# Altium project lga1700.PrjPCB (part 4 of 11)

## Sheet CPU_PWR - +VCCCORE_2_3.schdoc
size 420 x 298 mm; Symbol: Sheet-Symbol_A3; Company: 嘉立创EDA; Version: V1.0; Page Size: A3; @Project Name: H610(2024/12/09); @Page Count: 36; @Update Date: 2025-10-09; @Create Date: 2025-10-09; @Schematic Name: SCHEMATIC1; @Page No: 28; @Page Name: CPU_PWR - +VCCCORE_2/3; Device: Sheet-Symbol_A3; @Board Name: SCHEMATIC1; @Create Time: 10:15:42; @Update Time: 10:18:20
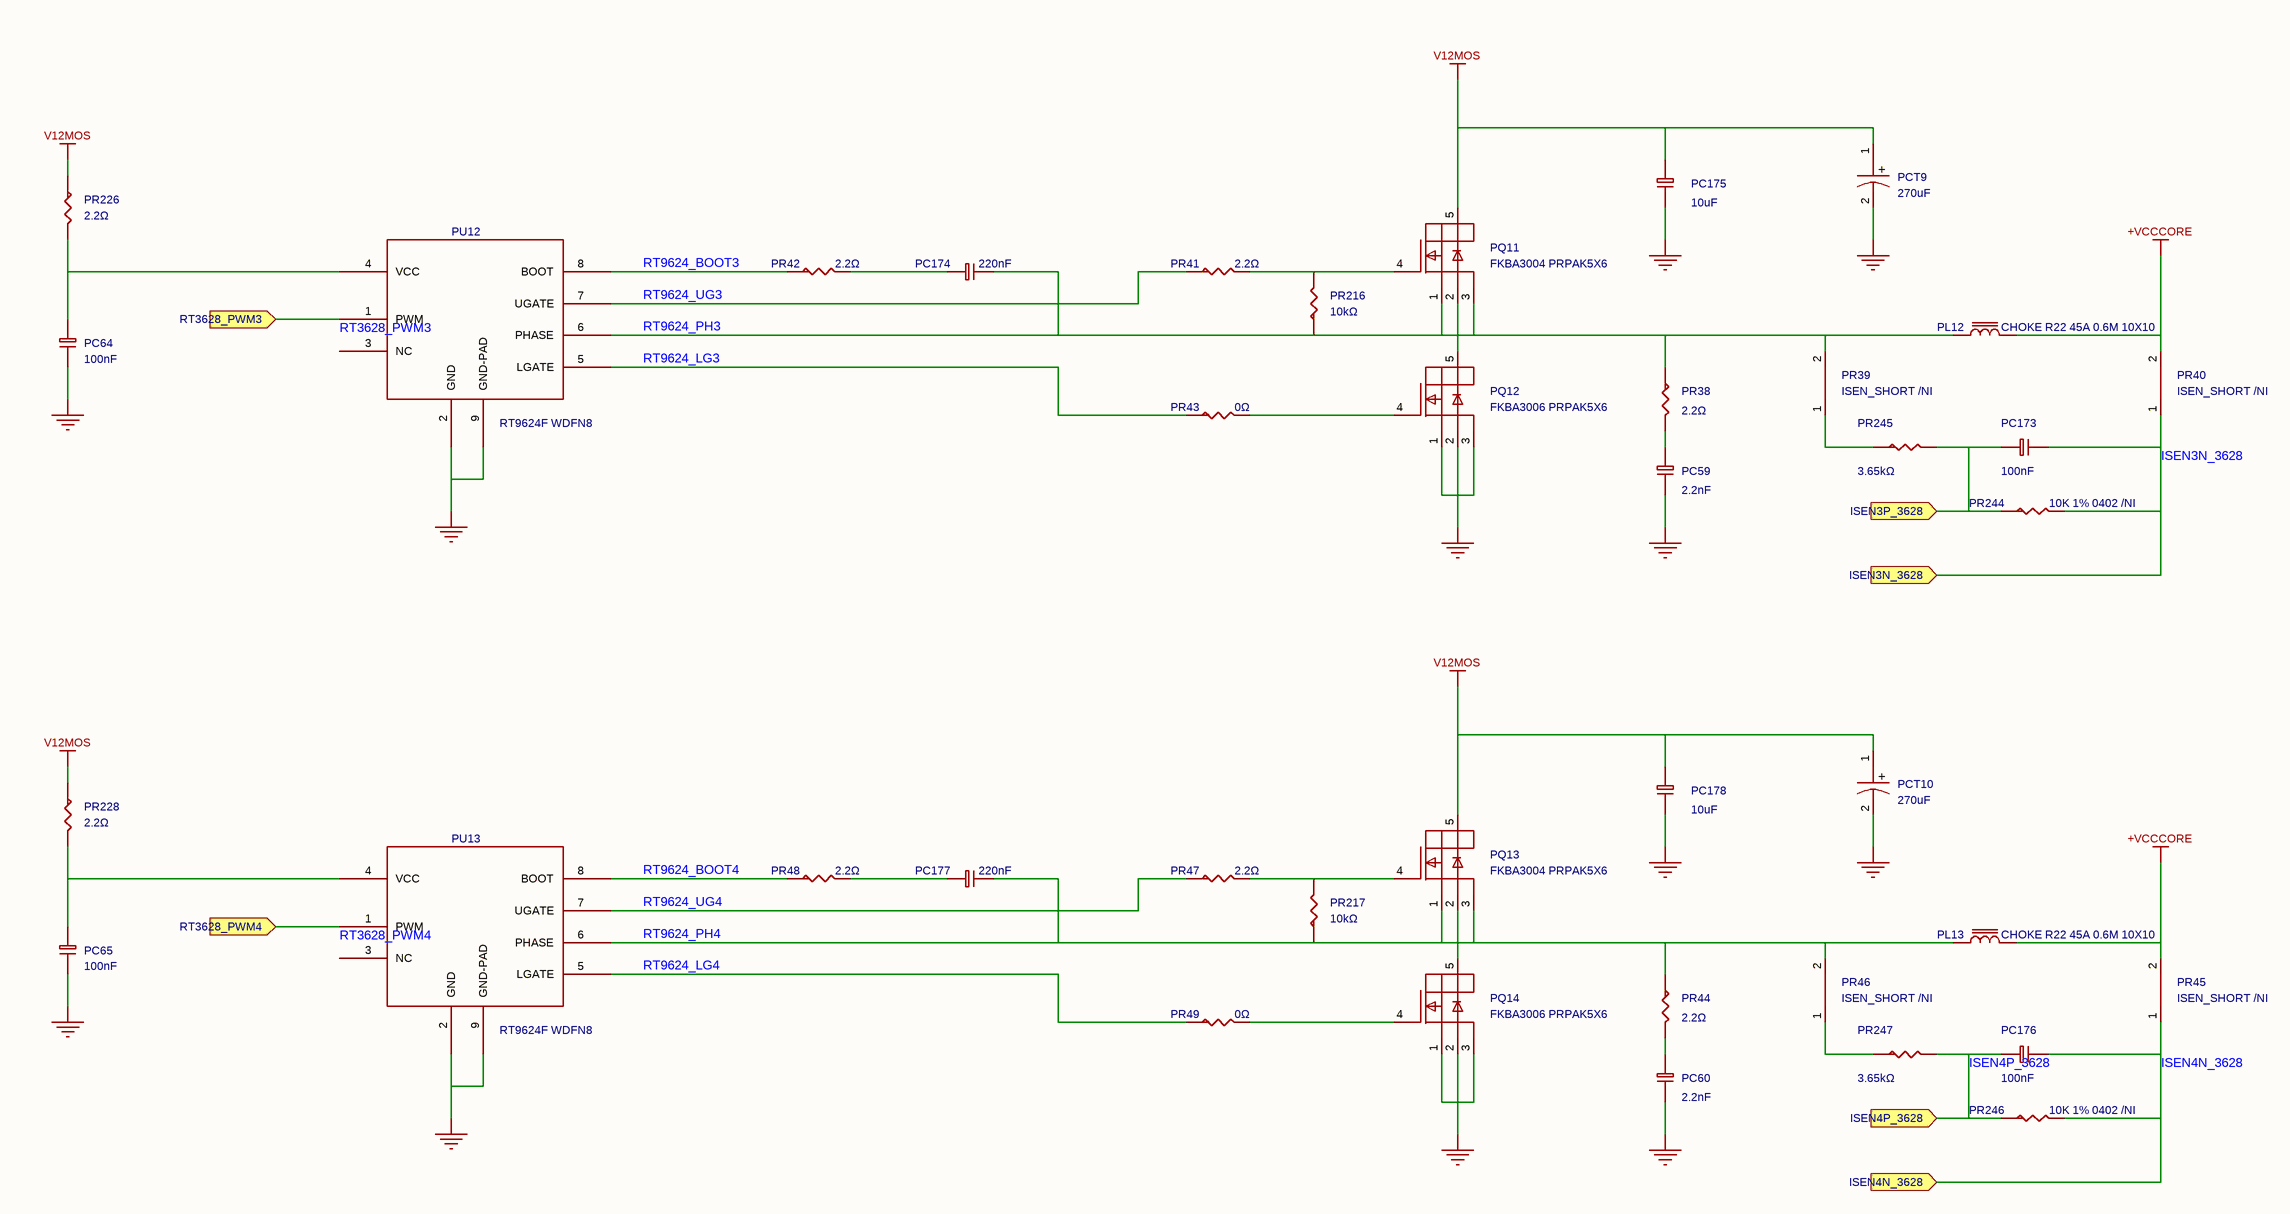
[diagram p13: CPU_PWR - +VCCCORE_2_3.schdoc]

### Parts
PC59  2.2nF  [C0402_2]
PC60  2.2nF  [C0402_3]
PC64  100nF  [C0402_1]
PC65  100nF  [C0402]
PC173  100nF  [C0402]
PC174  220nF  [C0402_1]
PC175  10uF  [C0805]
PC176  100nF  [C0402_1]
PC177  220nF  [C0402_2]
PC178  10uF  [C0805]
PCT9  270uF  [EC1P25C_1]
PCT10  270uF  [EC1P25C_2]
PL12  value CHOKE R22 45A 0.6M 10X10  [MAGIC R22]  (hidden comment: L_L70-P50-H70)
PL13  value CHOKE R22 45A 0.6M 10X10  [MAGIC R22]  (hidden comment: L_L70-P50-H70)
PQ11  value FKBA3004 PRPAK5X6  [PRPAK5X6_1]  (hidden comment: PK616BA)
PQ12  value FKBA3006 PRPAK5X6  [PRPAK5X6]  (hidden comment: PK616BA)
PQ13  value FKBA3004 PRPAK5X6  [PRPAK5X6_2]  (hidden comment: PK616BA)
PQ14  value FKBA3006 PRPAK5X6  [PRPAK5X6_3]  (hidden comment: PK616BA)
PR38  2.2Ω  [R0603_3]
PR39  value ISEN_SHORT /NI  [ISEN_SHORTNI]  (hidden comment: R_0)
PR40  value ISEN_SHORT /NI  [ISEN_SHORTNI]  (hidden comment: R_0)
PR41  2.2Ω  [R0603_1]
PR42  2.2Ω  [R0603_1]
PR43  0Ω  [R0603_3]
PR44  2.2Ω  [R0603_2]
PR45  value ISEN_SHORT /NI  [ISEN_SHORTNI_1]  (hidden comment: R_0)
PR46  value ISEN_SHORT /NI  [ISEN_SHORTNI_1]  (hidden comment: R_0)
PR47  2.2Ω  [R0603_1]
PR48  2.2Ω  [R0603_1]
PR49  0Ω  [R0603_2]
PR216  10kΩ  [R0402_1]
PR217  10kΩ  [R0402_2]
PR226  2.2Ω  [R0603]
PR228  2.2Ω  [R0603_2]
PR244  value 10K 1% 0402 /NI  [R0402_2]  (hidden comment: R-0603)
PR245  3.65kΩ  [R0402_2]
PR246  value 10K 1% 0402 /NI  [R0402_3]  (hidden comment: R-0603)
PR247  3.65kΩ  [R0402_3]
PU12  value RT9624F WDFN8  [DFN8_3X3MM-GND_1]  (hidden comment: RT9624FGQW)
PU13  value RT9624F WDFN8  [DFN8_3X3MM-GND_1]  (hidden comment: RT9624FGQW)

### Ports
ISEN3N_3628 (in), ISEN3P_3628 (in), ISEN4N_3628 (in), ISEN4P_3628 (in), RT3628_PWM3 (in), RT3628_PWM4 (in)

### Nets
+VCCCORE: PL12.2 PL13.2 PR40.2 PR45.2
GND: PC59.2 PC60.2 PC64.2 PC65.2 PC175.1 PC178.1 PCT9.2 PCT10.2 PQ12.1(SOURCE1) PQ12.2(SOURCE2) PQ12.3(SOURCE3) PQ14.1(SOURCE1) PQ14.2(SOURCE2) PQ14.3(SOURCE3) PU12.2(GND) PU12.9(GND-PAD) PU13.2(GND) PU13.9(GND-PAD)
V12MOS: PC175.2 PC178.2 PCT9.1 PCT10.1 PQ11.5(DRAIN1) PQ13.5(DRAIN1) PR226.1 PR228.1
ISEN3N_3628: PC173.2 PR40.1 PR244.2 ; port ISEN3N_3628
ISEN4N_3628: PC176.2 PR45.1 PR246.2 ; port ISEN4N_3628
ISEN4P_3628: PC176.1 PR246.1 PR247.2 ; port ISEN4P_3628
RT3628_PWM3: PU12.1(PWM) ; port RT3628_PWM3
RT3628_PWM4: PU13.1(PWM) ; port RT3628_PWM4
RT9624_BOOT3: PR42.1 PU12.8(BOOT)
RT9624_BOOT4: PR48.1 PU13.8(BOOT)
RT9624_LG3: PR43.1 PU12.5(LGATE)
RT9624_LG4: PR49.1 PU13.5(LGATE)
RT9624_PH3: PC174.2 PL12.1 PQ11.1(SOURCE1) PQ11.2(SOURCE2) PQ11.3(SOURCE3) PQ12.5(DRAIN1) PR38.1 PR39.2 PR216.1 PU12.6(PHASE)
RT9624_PH4: PC177.2 PL13.1 PQ13.1(SOURCE1) PQ13.2(SOURCE2) PQ13.3(SOURCE3) PQ14.5(DRAIN1) PR44.1 PR46.2 PR217.1 PU13.6(PHASE)
RT9624_UG3: PR41.1 PU12.7(UGATE)
RT9624_UG4: PR47.1 PU13.7(UGATE)
NetPC59_1: PC59.1 PR38.2
NetPC60_1: PC60.1 PR44.2
NetPC64_1: PC64.1 PR226.2 PU12.4(VCC)
NetPC65_1: PC65.1 PR228.2 PU13.4(VCC)
NetPC173_1: PC173.1 PR244.1 PR245.2 ; port ISEN3P_3628
NetPC174_1: PC174.1 PR42.2
NetPC177_1: PC177.1 PR48.2
NetPQ11_4: PQ11.4(GATE) PR41.2 PR216.2
NetPQ12_4: PQ12.4(GATE) PR43.2
NetPQ13_4: PQ13.4(GATE) PR47.2 PR217.2
NetPQ14_4: PQ14.4(GATE) PR49.2
NetPR39_1: PR39.1 PR245.1
NetPR46_1: PR46.1 PR247.1

Not connected (* = marked no-connect by the designer): PU12 3(NC); PU13 3(NC)

### Notes on the sheet
- 更新日期
- 2025-10-09
- 原理图
- 图页
- SCHEMATIC1
- CPU_PWR - +VCCCORE_2/3
- 创建日期
- 物料编码
- 审阅
- 绘制
- H610(2024/12/09)
- 版本
- V1.0
- 尺寸
- A3
- 页
- 28
- 嘉立创EDA
- 共
- 36
- (in symbol 160AREC271M0609) +

### Library data of the parts
PC59 PC60 = CC0402KRX7R9BB222: as PC57 on sheet CPU_PWR - +VCCCORE_1_3; Device: CC0402KRX7R9BB222; Value: 2.2nF; Supplier: LCSC; Datasheet: https://atta.szlcsc.com/upload/public/pdf/source/20170505/1493957848374.pdf; SupplierPart: C106861; ConvertToPcb: yes; LCSC Part Name: 2.2nF ±10% 50V; JLCPCB Part Class: Extended Part; ManufacturerPart: CC0402KRX7R9BB222; Supplier Footprint: 0402
  PC59: FootprintName: C0402_2
  PC60: FootprintName: C0402_3
PC64 PC176 = CL05B104KO5NNNC: as PC167 on sheet CPU_PWR - +VCCCORE_1_3; Device: CL05B104KO5NNNC; Value: 100nF; Supplier: LCSC; Datasheet: https://atta.szlcsc.com/upload/public/pdf/source/20160103/1457707674891.pdf; FootprintName: C0402_1; SupplierPart: C1525; ConvertToPcb: yes; LCSC Part Name: 100nF ±10% 16V; JLCPCB Part Class: Basic Part; ManufacturerPart: CL05B104KO5NNNC; Supplier Footprint: 0402
PC65 PC173 = CL05B104KO5NNNC: as PC62 on sheet CPU_PWR - +VCCCORE_1_3; Device: CL05B104KO5NNNC; PCB Footprint: C0402; Value: 100nF; Supplier: LCSC; Datasheet: https://atta.szlcsc.com/upload/public/pdf/source/20160103/1457707674891.pdf; FootprintName: C0402; SupplierPart: C1525; ConvertToPcb: yes; LCSC Part Name: 100nF ±10% 16V; JLCPCB Part Class: Basic Part; ManufacturerPart: CL05B104KO5NNNC; Supplier Footprint: 0402
PC174 PC177 = CC0402KRX5R7BB224: 容值:220nF;精度:±10%;额定电压:16V;材质(温度系数):X5R;; Manufacturer: YAGEO(国巨); Symbol: CAP; PCB Footprint: C0402; Tolerance: ±10%; ModelId: 36a51122f27c49738f86b3bfa98863e0; AddInBom: yes; Voltage Rated: 16V; ModelName: C0402_L1.0-W0.5-H0.5; ModelTransform: 39.37,19.685,0,0,0,0,0,0,0; Temperature Coefficient: X5R; Device: CC0402KRX5R7BB224; Value: 220nF; Supplier: LCSC; Datasheet: https://atta.szlcsc.com/upload/public/pdf/source/20170728/C106258_1501225689337848724.pdf; SupplierPart: C106258; ConvertToPcb: yes; LCSC Part Name: 220nF ±10% 16V; JLCPCB Part Class: Extended Part; ManufacturerPart: CC0402KRX5R7BB224; Supplier Footprint: 0402
  PC174: FootprintName: C0402_1
  PC177: FootprintName: C0402_2
PC175 PC178 = CL21A106KOQNNNE: as C635 on sheet COM; Device: CL21A106KOQNNNE; Value: 10uF; Supplier: LCSC; Datasheet: https://atta.szlcsc.com/upload/public/pdf/source/20160103/1457707694240.pdf; FootprintName: C0805; SupplierPart: C1713; ConvertToPcb: yes; LCSC Part Name: 10uF ±10% 16V; JLCPCB Part Class: Extended Part; ManufacturerPart: CL21A106KOQNNNE; Supplier Footprint: 0805
PCT9 PCT10 = 160AREC271M0609: as PCT7 on sheet CPU_PWR - +VCCCORE_1_3; Device: 160AREC271M0609; Value: 270uF; LCSC Part Name: 270uF ±20% 16V; SupplierPart: C176312; ManufacturerPart: 160AREC271M0609; Supplier Footprint: 插件,D6.3xL9mm; JLCPCB Part Class: Extended Part; Datasheet: https://atta.szlcsc.com/upload/public/pdf/source/20180420/C176312_A6CC051F3F5535015096354530D22B11.pdf; Supplier: LCSC; ConvertToPcb: yes; Ripple Current: 3.8A@100kHz; Equivalent Series Resistance(ESR): 15mΩ@100kHz~300kHz; Type: -; Lead Spacing: 2.5mm; Operating Temperature: -55℃~+105℃
  PCT9: FootprintName: EC1P25C_1
  PCT10: FootprintName: EC1P25C_2
PL12 = L_L70-P50-H70_1: Check: false; AddInBom: yes; Device: L_L70-P50-H70_1; Symbol: L_L70-P50-H70; FootprintName: MAGIC R22; ConvertToPcb: yes
PL13 = L_L70-P50-H70_2: Check: false; AddInBom: yes; Device: L_L70-P50-H70_2; Symbol: L_L70-P50-H70; FootprintName: MAGIC R22; ConvertToPcb: yes
PQ11-PQ14 = PK616BA: as PQ7-PQ10 on sheet CPU_PWR - +VCCCORE_1_3; Device: PK616BA; LCSC Part Name: 1个N沟道 耐压:30V 电流:50A; SupplierPart: C133608; ManufacturerPart: PK616BA; Supplier Footprint: PDFN-8(5.8x4.9); JLCPCB Part Class: Extended Part; Datasheet: https://atta.szlcsc.com/upload/public/pdf/source/20170930/C133608_1506736454344997453.pdf; Supplier: LCSC; ConvertToPcb: yes; Type: 1个N沟道; Drain Source On Resistance (RDS(on)@Vgs,Id): 9.5mΩ@4.5V,13A; Gate Threshold Voltage (Vgs(th)@Id): 3V@250uA
  PQ11: FootprintName: PRPAK5X6_1
  PQ12: FootprintName: PRPAK5X6
  PQ13: FootprintName: PRPAK5X6_2
  PQ14: FootprintName: PRPAK5X6_3
PR38 PR41 PR42 PR44 PR47 PR48 PR228 = 0603WAF220KT5E: as PR28 on sheet CPU_PWR - +VCCCORE_1_3; Device: 0603WAF220KT5E; Value: 2.2Ω; Type: 厚膜电阻; Supplier: LCSC; Datasheet: https://atta.szlcsc.com/upload/public/pdf/source/20200306/C422600_1E6D84923E4A46A82E41ADD87F860B5C.pdf; SupplierPart: C22939; ConvertToPcb: yes; LCSC Part Name: 2.2Ω ±1% 100mW; JLCPCB Part Class: Basic Part; ManufacturerPart: 0603WAF220KT5E; Supplier Footprint: 0603; Operating Temperature Range: -55℃~+155℃
  PR38: FootprintName: R0603_3
  PR41 PR42 PR47 PR48: FootprintName: R0603_1
  PR44 PR228: FootprintName: R0603_2
PR39 = R_0: Check: false; AddInBom: yes; Device: R_0; Symbol: R_0; FootprintName: ISEN_SHORTNI; ConvertToPcb: yes
PR40 = R_0: 跳线; Check: false; AddInBom: yes; Device: R_0; Symbol: R_0; FootprintName: ISEN_SHORTNI; ConvertToPcb: yes
PR43 PR49 = 0603WAF0000T5E: as PR34 on sheet CPU_PWR - +VCCCORE_1_3; Device: 0603WAF0000T5E; Value: 0Ω; Type: 厚膜电阻; Supplier: LCSC; Datasheet: https://atta.szlcsc.com/upload/public/pdf/source/20200306/C422600_1E6D84923E4A46A82E41ADD87F860B5C.pdf; SupplierPart: C21189; ConvertToPcb: yes; LCSC Part Name: 0Ω ±1% 100mW; JLCPCB Part Class: Basic Part; ManufacturerPart: 0603WAF0000T5E; Supplier Footprint: 0603; Operating Temperature Range: -55℃~+155℃
  PR43: FootprintName: R0603_3
  PR49: FootprintName: R0603_2
PR45 PR46 = R_1: Check: false; AddInBom: yes; Device: R_1; Symbol: R_0; FootprintName: ISEN_SHORTNI_1; ConvertToPcb: yes
PR216 PR217 = 0402WGF1002TCE: as PR214 on sheet CPU_PWR - +VCCCORE_1_3; Device: 0402WGF1002TCE; Value: 10kΩ; Type: 厚膜电阻; Supplier: LCSC; Datasheet: https://atta.szlcsc.com/upload/public/pdf/source/20200306/C422600_1E6D84923E4A46A82E41ADD87F860B5C.pdf; SupplierPart: C25744; ConvertToPcb: yes; LCSC Part Name: 10kΩ ±1% 62.5mW; JLCPCB Part Class: Basic Part; ManufacturerPart: 0402WGF1002TCE; Supplier Footprint: 0402; Operating Temperature Range: -55℃~+155℃
  PR216: FootprintName: R0402_1
  PR217: FootprintName: R0402_2
PR226 = 0603WAF220KT5E: as PR224 on sheet CPU_PWR - +VCCCORE_1_3; Device: 0603WAF220KT5E; Value: 2.2Ω; Type: 厚膜电阻; Supplier: LCSC; Datasheet: https://atta.szlcsc.com/upload/public/pdf/source/20200306/C422600_1E6D84923E4A46A82E41ADD87F860B5C.pdf; FootprintName: R0603; SupplierPart: C22939; ModelName: R0603; ConvertToPcb: yes; LCSC Part Name: 2.2Ω ±1% 100mW; JLCPCB Part Class: Basic Part; ManufacturerPart: 0603WAF220KT5E; Supplier Footprint: 0603; Operating Temperature Range: -55℃~+155℃
PR244 = R-0603_2: as PR240 on sheet CPU_PWR - +VCCCORE_1_3; Device: R-0603_2; Symbol: R-0603; LCSC Part Name: 厚膜电阻 10kΩ ±1% 62.5mW; Supplier Part: C60490; Supplier Footprint: 0402; JLCPCB Part Class: Extended Part; Datasheet: https://atta.szlcsc.com/upload/public/pdf/source/20170925/C131467_1506321478108990263.pdf; Supplier: LCSC; Type: 厚膜电阻; Operating Temperature Range: -55℃~+155℃; FootprintName: R0402_2; ConvertToPcb: yes
PR245 PR247 = ERJ2RKF3651X: as PR241 on sheet CPU_PWR - +VCCCORE_1_3; Device: ERJ2RKF3651X; Value: 3.65kΩ; LCSC Part Name: 3.65kΩ ±1% 100mW 厚膜电阻; SupplierPart: C416527; ManufacturerPart: ERJ2RKF3651X; Supplier Footprint: 0402; JLCPCB Part Class: Extended Part; Datasheet: https://atta.szlcsc.com/upload/public/pdf/source/20190902/C416527_C4564A8D72F3E2A9CDC3D7769B95121D.pdf; Supplier: LCSC; ConvertToPcb: yes; Type: 厚膜电阻; Temperature Coefficient: ±100ppm/℃; Operating Temperature Range: -55℃~+155℃
  PR245: FootprintName: R0402_2
  PR247: FootprintName: R0402_3
PR246 = R-0603: Manufacturer: YAGEO(国巨); Manufacturer Part: RC0402FR-0710KL; 3D Model: 671aefced39d4c318694bba8bd8efd39; 3D Model Transform: 39.37,19.685,0,0,0,0,0,0.0005,0; Tolerance: ±1%; Power(Watts): 62.5mW; Overload Voltage (Max): 50V; Temperature Coefficient: ±100ppm/℃; AddInBom: yes; Device: R-0603; Symbol: R-0603; LCSC Part Name: 厚膜电阻 10kΩ ±1% 62.5mW; Supplier Part: C60490; Supplier Footprint: 0402; JLCPCB Part Class: Extended Part; Datasheet: https://atta.szlcsc.com/upload/public/pdf/source/20170925/C131467_1506321478108990263.pdf; Supplier: LCSC; Type: 厚膜电阻; Operating Temperature Range: -55℃~+155℃; FootprintName: R0402_3; ConvertToPcb: yes
PU12 PU13 = RT9624FGQW: as PU10 on sheet CPU_PWR - +VCCCORE_1_3; Device: RT9624FGQW; LCSC Part Name: Single Phase Synchronous Rectified Buck MOSFET Driver; SupplierPart: C3020454; ManufacturerPart: RT9624FGQW; Supplier Footprint: TDFN-8-EP(3x3); JLCPCB Part Class: Extended Part; Datasheet: https://atta.szlcsc.com/upload/public/pdf/source/20220608/64F557171D909C63F38446B0F2BC2FB2.pdf; Supplier: LCSC; ConvertToPcb: yes; FootprintName: DFN8_3X3MM-GND_1

## Sheet CPU_PWR - +VCCCORE_3_3.schdoc
size 420 x 297 mm; Symbol: Sheet-Symbol_A4; Company: 嘉立创EDA; Version: V1.0; Page Size: A4; @Project Name: 【全网首发】X86电脑主板_copy; @Page Count: 24; @Update Date: 2025-10-09; @Create Date: 2025-10-09; @Schematic Name: SCHEMATIC1_1; @Page No: 0; @Page Name: CPU_PWR - +VCCCORE_3/3; Device: Sheet-Symbol_A4_1; Border: 1; Width: 1655; Height: 1170; Region Start: 1; X Region Count: 6; Y Region Count: 4; Blade Width: 10; Title Block Position: 3
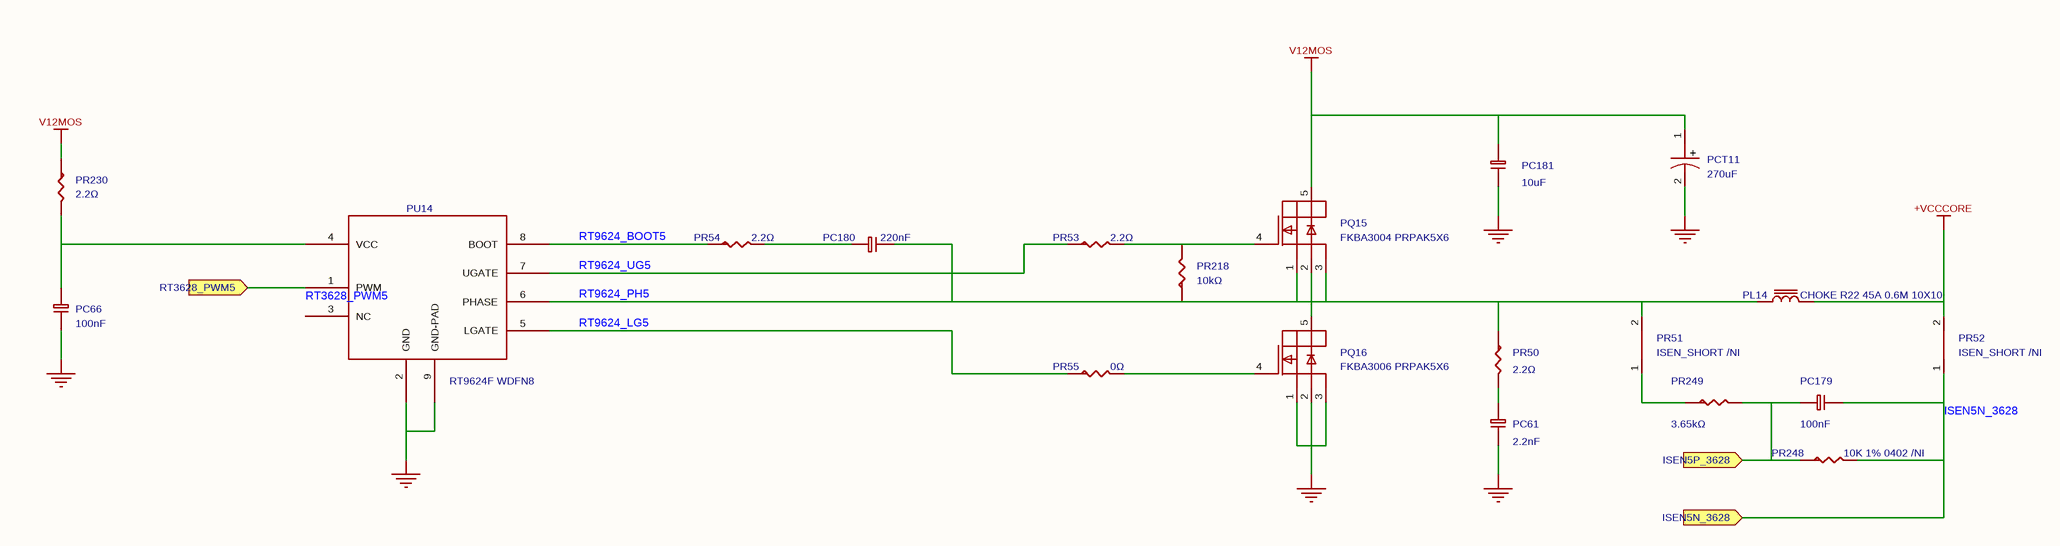
[diagram p14: CPU_PWR - +VCCCORE_3_3.schdoc]

### Parts
PC61  2.2nF  [C0402_3]
PC66  100nF  [C0402_3]
PC179  100nF  [C0402_2]
PC180  220nF  [C0402]
PC181  10uF  [C0805]
PCT11  270uF  [EC1P25C_2]
PL14  value CHOKE R22 45A 0.6M 10X10  [MAGIC R22]  (hidden comment: L_L70-P50-H70)
PQ15  value FKBA3004 PRPAK5X6  [PRPAK5X6_4]  (hidden comment: PK616BA)
PQ16  value FKBA3006 PRPAK5X6  [PRPAK5X6_5]  (hidden comment: PK616BA)
PR50  2.2Ω  [R0603_2]
PR51  value ISEN_SHORT /NI  [ISEN_SHORTNI_1]  (hidden comment: R_0)
PR52  value ISEN_SHORT /NI  [ISEN_SHORTNI_1]  (hidden comment: R_0)
PR53  2.2Ω  [R0603_1]
PR54  2.2Ω  [R0603]
PR55  0Ω  [R0603_2]
PR218  10kΩ  [R0402_2]
PR230  2.2Ω  [R0603]
PR248  value 10K 1% 0402 /NI  [R0402_1]  (hidden comment: R-0603)
PR249  3.65kΩ  [R0402_1]
PU14  value RT9624F WDFN8  [DFN8_3X3MM-GND_2]  (hidden comment: RT9624FGQW)

### Ports
ISEN5N_3628 (in), ISEN5P_3628 (in), RT3628_PWM5 (in)

### Nets
+VCCCORE: PL14.2 PR52.2
GND: PC61.2 PC66.2 PC181.1 PCT11.2 PQ16.1(SOURCE1) PQ16.2(SOURCE2) PQ16.3(SOURCE3) PU14.2(GND) PU14.9(GND-PAD)
V12MOS: PC181.2 PCT11.1 PQ15.5(DRAIN1) PR230.1
ISEN5N_3628: PC179.2 PR52.1 PR248.2 ; port ISEN5N_3628
RT3628_PWM5: PU14.1(PWM) ; port RT3628_PWM5
RT9624_BOOT5: PR54.1 PU14.8(BOOT)
RT9624_LG5: PR55.1 PU14.5(LGATE)
RT9624_PH5: PC180.2 PL14.1 PQ15.1(SOURCE1) PQ15.2(SOURCE2) PQ15.3(SOURCE3) PQ16.5(DRAIN1) PR50.1 PR51.2 PR218.1 PU14.6(PHASE)
RT9624_UG5: PR53.1 PU14.7(UGATE)
NetPC61_1: PC61.1 PR50.2
NetPC66_1: PC66.1 PR230.2 PU14.4(VCC)
NetPC179_1: PC179.1 PR248.1 PR249.2 ; port ISEN5P_3628
NetPC180_1: PC180.1 PR54.2
NetPQ15_4: PQ15.4(GATE) PR53.2 PR218.2
NetPQ16_4: PQ16.4(GATE) PR55.2
NetPR51_1: PR51.1 PR249.1

Not connected (* = marked no-connect by the designer): PU14 3(NC)

### Notes on the sheet
- 2025-10-09
- 更新日期
- SCHEMATIC1_1
- CPU_PWR - +VCCCORE_3/3
- 原理图
- 图页
- 创建日期
- 物料编码
- 【全网首发】X86电脑主板_copy
- 审阅
- 绘制
- V1.0
- A4
- 0
- 嘉立创EDA
- 24
- 版本
- 尺寸
- 页
- 共
- 1
- (in symbol 160AREC271M0609) +

### Library data of the parts
PC61 = CC0402KRX7R9BB222: as PC57 on sheet CPU_PWR - +VCCCORE_1_3; Device: CC0402KRX7R9BB222; Value: 2.2nF; Supplier: LCSC; Datasheet: https://atta.szlcsc.com/upload/public/pdf/source/20170505/1493957848374.pdf; FootprintName: C0402_3; SupplierPart: C106861; ConvertToPcb: yes; LCSC Part Name: 2.2nF ±10% 50V; JLCPCB Part Class: Extended Part; ManufacturerPart: CC0402KRX7R9BB222; Supplier Footprint: 0402
PC66 PC179 = CL05B104KO5NNNC: as PC167 on sheet CPU_PWR - +VCCCORE_1_3; Device: CL05B104KO5NNNC; Value: 100nF; Supplier: LCSC; Datasheet: https://atta.szlcsc.com/upload/public/pdf/source/20160103/1457707674891.pdf; SupplierPart: C1525; ConvertToPcb: yes; LCSC Part Name: 100nF ±10% 16V; JLCPCB Part Class: Basic Part; ManufacturerPart: CL05B104KO5NNNC; Supplier Footprint: 0402
  PC66: FootprintName: C0402_3
  PC179: FootprintName: C0402_2
PC180 = CC0402KRX5R7BB224: 容值:220nF;精度:±10%;额定电压:16V;材质(温度系数):X5R;; Manufacturer: YAGEO(国巨); Symbol: CAP; Tolerance: ±10%; ModelId: 36a51122f27c49738f86b3bfa98863e0; AddInBom: yes; Voltage Rated: 16V; ModelName: C0402_L1.0-W0.5-H0.5; ModelTransform: 39.37,19.685,0,0,0,0,0,0,0; Temperature Coefficient: X5R; Device: CC0402KRX5R7BB224; PCB Footprint: C0402; Value: 220nF; Supplier: LCSC; Datasheet: https://atta.szlcsc.com/upload/public/pdf/source/20170728/C106258_1501225689337848724.pdf; FootprintName: C0402; SupplierPart: C106258; ConvertToPcb: yes; LCSC Part Name: 220nF ±10% 16V; JLCPCB Part Class: Extended Part; ManufacturerPart: CC0402KRX5R7BB224; Supplier Footprint: 0402
PC181 = CL21A106KOQNNNE: as C635 on sheet COM; Device: CL21A106KOQNNNE; Value: 10uF; Supplier: LCSC; Datasheet: https://atta.szlcsc.com/upload/public/pdf/source/20160103/1457707694240.pdf; FootprintName: C0805; SupplierPart: C1713; ConvertToPcb: yes; LCSC Part Name: 10uF ±10% 16V; JLCPCB Part Class: Extended Part; ManufacturerPart: CL21A106KOQNNNE; Supplier Footprint: 0805
PCT11 = 160AREC271M0609: as PCT7 on sheet CPU_PWR - +VCCCORE_1_3; Device: 160AREC271M0609; Value: 270uF; LCSC Part Name: 270uF ±20% 16V; SupplierPart: C176312; ManufacturerPart: 160AREC271M0609; Supplier Footprint: 插件,D6.3xL9mm; JLCPCB Part Class: Extended Part; Datasheet: https://atta.szlcsc.com/upload/public/pdf/source/20180420/C176312_A6CC051F3F5535015096354530D22B11.pdf; Supplier: LCSC; ConvertToPcb: yes; FootprintName: EC1P25C_2; Ripple Current: 3.8A@100kHz; Equivalent Series Resistance(ESR): 15mΩ@100kHz~300kHz; Type: -; Lead Spacing: 2.5mm; Operating Temperature: -55℃~+105℃
PL14 = L_L70-P50-H70_2: Check: false; AddInBom: yes; Device: L_L70-P50-H70_2; Symbol: L_L70-P50-H70; FootprintName: MAGIC R22; ConvertToPcb: yes
PQ15 PQ16 = PK616BA: as PQ7-PQ10 on sheet CPU_PWR - +VCCCORE_1_3; Device: PK616BA; LCSC Part Name: 1个N沟道 耐压:30V 电流:50A; SupplierPart: C133608; ManufacturerPart: PK616BA; Supplier Footprint: PDFN-8(5.8x4.9); JLCPCB Part Class: Extended Part; Datasheet: https://atta.szlcsc.com/upload/public/pdf/source/20170930/C133608_1506736454344997453.pdf; Supplier: LCSC; ConvertToPcb: yes; Type: 1个N沟道; Drain Source On Resistance (RDS(on)@Vgs,Id): 9.5mΩ@4.5V,13A; Gate Threshold Voltage (Vgs(th)@Id): 3V@250uA
  PQ15: FootprintName: PRPAK5X6_4
  PQ16: FootprintName: PRPAK5X6_5
PR50 PR53 = 0603WAF220KT5E: as PR28 on sheet CPU_PWR - +VCCCORE_1_3; Device: 0603WAF220KT5E; Value: 2.2Ω; Type: 厚膜电阻; Supplier: LCSC; Datasheet: https://atta.szlcsc.com/upload/public/pdf/source/20200306/C422600_1E6D84923E4A46A82E41ADD87F860B5C.pdf; SupplierPart: C22939; ConvertToPcb: yes; LCSC Part Name: 2.2Ω ±1% 100mW; JLCPCB Part Class: Basic Part; ManufacturerPart: 0603WAF220KT5E; Supplier Footprint: 0603; Operating Temperature Range: -55℃~+155℃
  PR50: FootprintName: R0603_2
  PR53: FootprintName: R0603_1
PR51 PR52 = R_1: Check: false; AddInBom: yes; Device: R_1; Symbol: R_0; FootprintName: ISEN_SHORTNI_1; ConvertToPcb: yes
PR54 PR230 = 0603WAF220KT5E: as PR224 on sheet CPU_PWR - +VCCCORE_1_3; Device: 0603WAF220KT5E; Value: 2.2Ω; Type: 厚膜电阻; Supplier: LCSC; Datasheet: https://atta.szlcsc.com/upload/public/pdf/source/20200306/C422600_1E6D84923E4A46A82E41ADD87F860B5C.pdf; FootprintName: R0603; SupplierPart: C22939; ModelName: R0603; ConvertToPcb: yes; LCSC Part Name: 2.2Ω ±1% 100mW; JLCPCB Part Class: Basic Part; ManufacturerPart: 0603WAF220KT5E; Supplier Footprint: 0603; Operating Temperature Range: -55℃~+155℃
PR55 = 0603WAF0000T5E: as PR34 on sheet CPU_PWR - +VCCCORE_1_3; Device: 0603WAF0000T5E; Value: 0Ω; Type: 厚膜电阻; Supplier: LCSC; Datasheet: https://atta.szlcsc.com/upload/public/pdf/source/20200306/C422600_1E6D84923E4A46A82E41ADD87F860B5C.pdf; FootprintName: R0603_2; SupplierPart: C21189; ConvertToPcb: yes; LCSC Part Name: 0Ω ±1% 100mW; JLCPCB Part Class: Basic Part; ManufacturerPart: 0603WAF0000T5E; Supplier Footprint: 0603; Operating Temperature Range: -55℃~+155℃
PR218 = 0402WGF1002TCE: as PR214 on sheet CPU_PWR - +VCCCORE_1_3; Device: 0402WGF1002TCE; Value: 10kΩ; Type: 厚膜电阻; Supplier: LCSC; Datasheet: https://atta.szlcsc.com/upload/public/pdf/source/20200306/C422600_1E6D84923E4A46A82E41ADD87F860B5C.pdf; FootprintName: R0402_2; SupplierPart: C25744; ConvertToPcb: yes; LCSC Part Name: 10kΩ ±1% 62.5mW; JLCPCB Part Class: Basic Part; ManufacturerPart: 0402WGF1002TCE; Supplier Footprint: 0402; Operating Temperature Range: -55℃~+155℃
PR248 = R-0603_3: as PR242 on sheet CPU_PWR - +VCCCORE_1_3; Device: R-0603_3; Symbol: R-0603; LCSC Part Name: 厚膜电阻 10kΩ ±1% 62.5mW; Supplier Part: C60490; Supplier Footprint: 0402; JLCPCB Part Class: Extended Part; Datasheet: https://atta.szlcsc.com/upload/public/pdf/source/20170925/C131467_1506321478108990263.pdf; Supplier: LCSC; Type: 厚膜电阻; Operating Temperature Range: -55℃~+155℃; FootprintName: R0402_1; ConvertToPcb: yes
PR249 = ERJ2RKF3651X: as PR241 on sheet CPU_PWR - +VCCCORE_1_3; Device: ERJ2RKF3651X; Value: 3.65kΩ; LCSC Part Name: 3.65kΩ ±1% 100mW 厚膜电阻; SupplierPart: C416527; ManufacturerPart: ERJ2RKF3651X; Supplier Footprint: 0402; JLCPCB Part Class: Extended Part; Datasheet: https://atta.szlcsc.com/upload/public/pdf/source/20190902/C416527_C4564A8D72F3E2A9CDC3D7769B95121D.pdf; Supplier: LCSC; ConvertToPcb: yes; FootprintName: R0402_1; Type: 厚膜电阻; Temperature Coefficient: ±100ppm/℃; Operating Temperature Range: -55℃~+155℃
PU14 = RT9624FGQW: as PU10 on sheet CPU_PWR - +VCCCORE_1_3; Device: RT9624FGQW; LCSC Part Name: Single Phase Synchronous Rectified Buck MOSFET Driver; SupplierPart: C3020454; ManufacturerPart: RT9624FGQW; Supplier Footprint: TDFN-8-EP(3x3); JLCPCB Part Class: Extended Part; Datasheet: https://atta.szlcsc.com/upload/public/pdf/source/20220608/64F557171D909C63F38446B0F2BC2FB2.pdf; Supplier: LCSC; ConvertToPcb: yes; FootprintName: DFN8_3X3MM-GND_2

## Sheet CPU_PWR - +VCCGT.schdoc
size 420 x 298 mm; Symbol: Sheet-Symbol_A3; Company: 嘉立创EDA; Version: V1.0; Page Size: A3; @Project Name: 【全网首发】X86电脑主板_copy; @Page Count: 35; @Update Date: 2025-10-09; @Create Date: 2025-10-09; @Schematic Name: SCHEMATIC1_1; @Page No: 0; @Page Name: CPU_PWR - +VCCGT; Device: Sheet-Symbol_A3
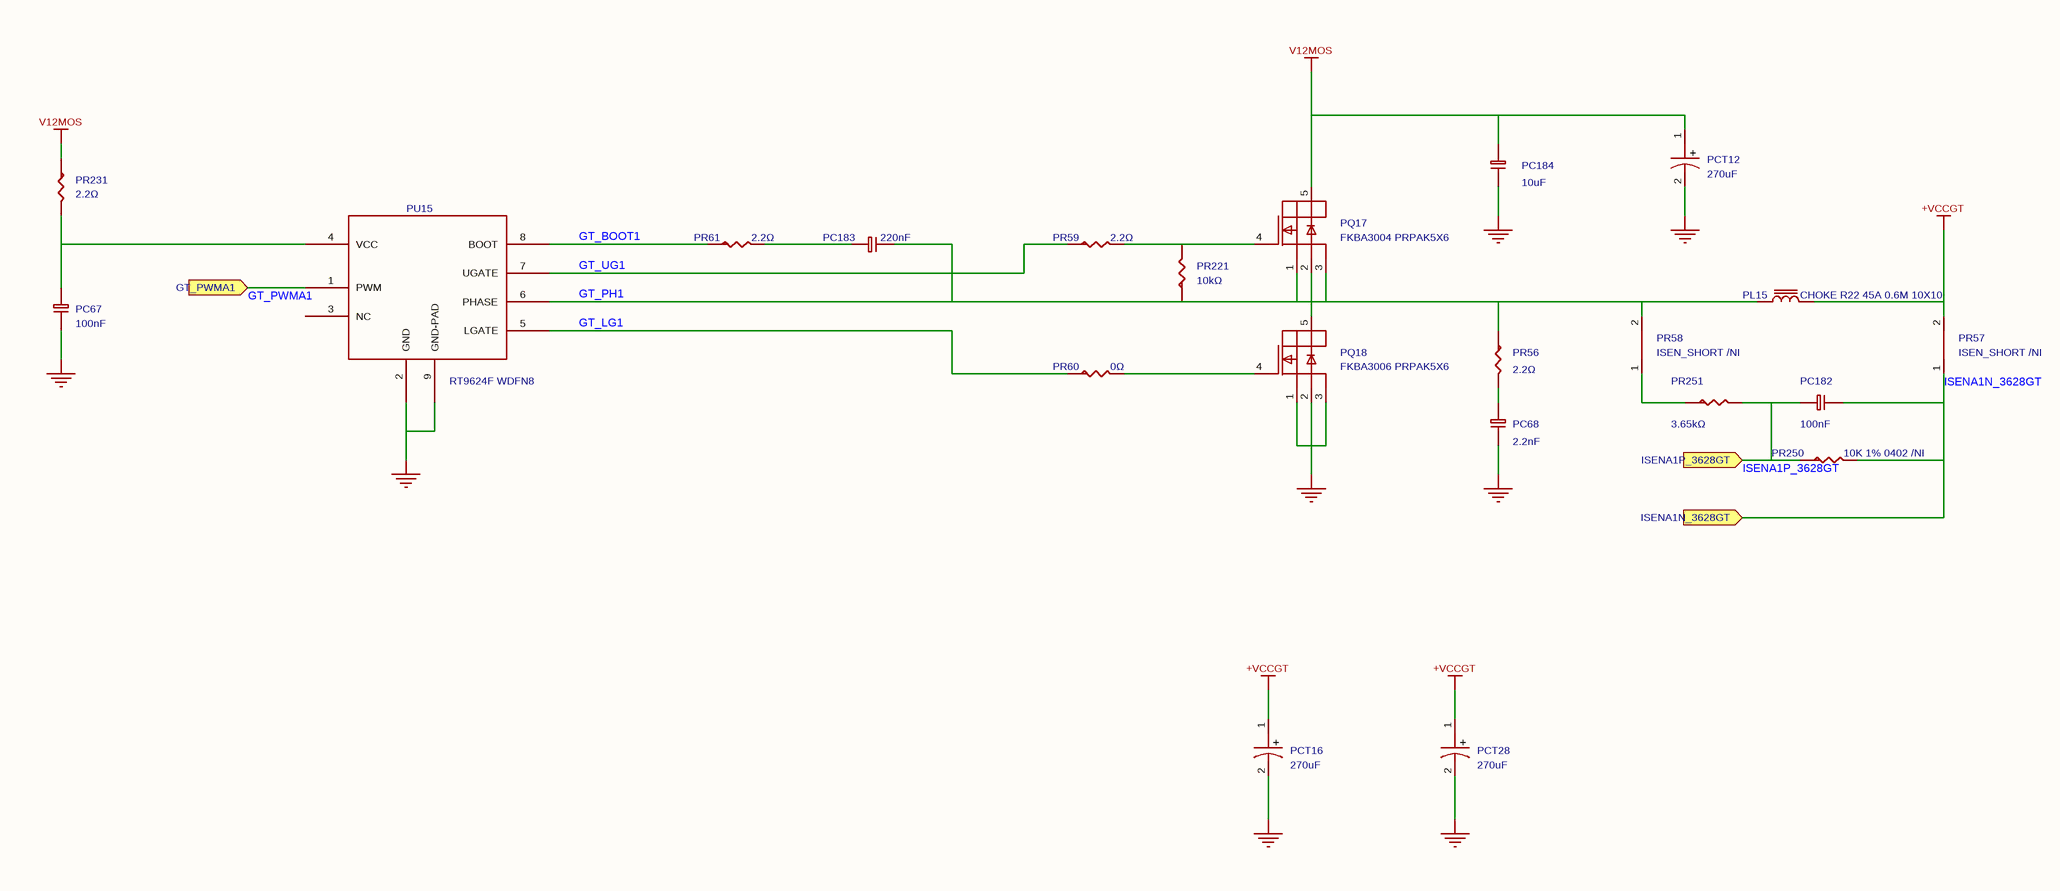
[diagram p15: CPU_PWR - +VCCGT.schdoc]

### Parts
PC67  100nF  [C0402_3]
PC68  2.2nF  [C0402_3]
PC182  100nF  [C0402_1]
PC183  220nF  [C0402_3]
PC184  10uF  [C0805_2]
PCT12  270uF  [EC1P25C_2]
PCT16  270uF  [EC1P25C_2]
PCT28  270uF  [EC1P25C_2]
PL15  value CHOKE R22 45A 0.6M 10X10  [MAGIC R22]  (hidden comment: L_L70-P50-H70)
PQ17  value FKBA3004 PRPAK5X6  [PRPAK5X6_4]  (hidden comment: PK616BA)
PQ18  value FKBA3006 PRPAK5X6  [PRPAK5X6_3]  (hidden comment: PK616BA)
PR56  2.2Ω  [R0603_2]
PR57  value ISEN_SHORT /NI  [ISEN_SHORTNI_1]  (hidden comment: R_0)
PR58  value ISEN_SHORT /NI  [ISEN_SHORTNI_1]  (hidden comment: R_0)
PR59  2.2Ω  [R0603_1]
PR60  0Ω  [R0603_2]
PR61  2.2Ω  [R0603_1]
PR221  10kΩ  [R0402_2]
PR231  2.2Ω  [R0603_1]
PR250  value 10K 1% 0402 /NI  [R0402_2]  (hidden comment: R-0603)
PR251  3.65kΩ  [R0402]
PU15  value RT9624F WDFN8  [DFN8_3X3MM-GND_1]  (hidden comment: RT9624FGQW)

### Ports
GT_PWMA1 (in), ISENA1N_3628GT (in), ISENA1P_3628GT (in)

### Nets
+VCCGT: PCT16.1 PCT28.1 PL15.2 PR57.2
GND: PC67.2 PC68.2 PC184.1 PCT12.2 PCT16.2 PCT28.2 PQ18.1(SOURCE1) PQ18.2(SOURCE2) PQ18.3(SOURCE3) PU15.2(GND) PU15.9(GND-PAD)
V12MOS: PC184.2 PCT12.1 PQ17.5(DRAIN1) PR231.1
GT_BOOT1: PR61.1 PU15.8(BOOT)
GT_LG1: PR60.1 PU15.5(LGATE)
GT_PH1: PC183.2 PL15.1 PQ17.1(SOURCE1) PQ17.2(SOURCE2) PQ17.3(SOURCE3) PQ18.5(DRAIN1) PR56.1 PR58.2 PR221.1 PU15.6(PHASE)
GT_PWMA1: PU15.1(PWM) ; port GT_PWMA1
GT_UG1: PR59.1 PU15.7(UGATE)
ISENA1N_3628GT: PC182.2 PR57.1 PR250.2 ; port ISENA1N_3628GT
ISENA1P_3628GT: PC182.1 PR250.1 PR251.2 ; port ISENA1P_3628GT
NetPC67_1: PC67.1 PR231.2 PU15.4(VCC)
NetPC68_1: PC68.1 PR56.2
NetPC183_1: PC183.1 PR61.2
NetPQ17_4: PQ17.4(GATE) PR59.2 PR221.2
NetPQ18_4: PQ18.4(GATE) PR60.2
NetPR58_1: PR58.1 PR251.1

Not connected (* = marked no-connect by the designer): PU15 3(NC)

### Notes on the sheet
- 更新日期
- 2025-10-09
- 原理图
- 图页
- SCHEMATIC1_1
- CPU_PWR - +VCCGT
- 创建日期
- 物料编码
- 审阅
- 绘制
- 【全网首发】X86电脑主板_copy
- 版本
- V1.0
- 尺寸
- A3
- 页
- 0
- 嘉立创EDA
- 共
- 35
- (in symbol 160AREC271M0609) +

### Library data of the parts
PC67 PC182 = CL05B104KO5NNNC: as PC167 on sheet CPU_PWR - +VCCCORE_1_3; Device: CL05B104KO5NNNC; Value: 100nF; Supplier: LCSC; Datasheet: https://atta.szlcsc.com/upload/public/pdf/source/20160103/1457707674891.pdf; SupplierPart: C1525; ConvertToPcb: yes; LCSC Part Name: 100nF ±10% 16V; JLCPCB Part Class: Basic Part; ManufacturerPart: CL05B104KO5NNNC; Supplier Footprint: 0402
  PC67: FootprintName: C0402_3
  PC182: FootprintName: C0402_1
PC68 = CC0402KRX7R9BB222: as PC57 on sheet CPU_PWR - +VCCCORE_1_3; Device: CC0402KRX7R9BB222; Value: 2.2nF; Supplier: LCSC; Datasheet: https://atta.szlcsc.com/upload/public/pdf/source/20170505/1493957848374.pdf; FootprintName: C0402_3; SupplierPart: C106861; ConvertToPcb: yes; LCSC Part Name: 2.2nF ±10% 50V; JLCPCB Part Class: Extended Part; ManufacturerPart: CC0402KRX7R9BB222; Supplier Footprint: 0402
PC183 = CC0402KRX5R7BB224: as PC174 on sheet CPU_PWR - +VCCCORE_2_3; Device: CC0402KRX5R7BB224; Value: 220nF; Supplier: LCSC; Datasheet: https://atta.szlcsc.com/upload/public/pdf/source/20170728/C106258_1501225689337848724.pdf; FootprintName: C0402_3; SupplierPart: C106258; ConvertToPcb: yes; LCSC Part Name: 220nF ±10% 16V; JLCPCB Part Class: Extended Part; ManufacturerPart: CC0402KRX5R7BB224; Supplier Footprint: 0402
PC184 = CL21A106KOQNNNE: as C635 on sheet COM; Device: CL21A106KOQNNNE; Value: 10uF; Supplier: LCSC; Datasheet: https://atta.szlcsc.com/upload/public/pdf/source/20160103/1457707694240.pdf; FootprintName: C0805_2; SupplierPart: C1713; ConvertToPcb: yes; LCSC Part Name: 10uF ±10% 16V; JLCPCB Part Class: Extended Part; ManufacturerPart: CL21A106KOQNNNE; Supplier Footprint: 0805
PCT12 PCT16 PCT28 = 160AREC271M0609: as PCT7 on sheet CPU_PWR - +VCCCORE_1_3; Device: 160AREC271M0609; Value: 270uF; LCSC Part Name: 270uF ±20% 16V; SupplierPart: C176312; ManufacturerPart: 160AREC271M0609; Supplier Footprint: 插件,D6.3xL9mm; JLCPCB Part Class: Extended Part; Datasheet: https://atta.szlcsc.com/upload/public/pdf/source/20180420/C176312_A6CC051F3F5535015096354530D22B11.pdf; Supplier: LCSC; ConvertToPcb: yes; FootprintName: EC1P25C_2; Ripple Current: 3.8A@100kHz; Equivalent Series Resistance(ESR): 15mΩ@100kHz~300kHz; Type: -; Lead Spacing: 2.5mm; Operating Temperature: -55℃~+105℃
PL15 = L_L70-P50-H70_3: Check: false; AddInBom: yes; Device: L_L70-P50-H70_3; Symbol: L_L70-P50-H70; FootprintName: MAGIC R22; ConvertToPcb: yes
PQ17 PQ18 = PK616BA: as PQ7-PQ10 on sheet CPU_PWR - +VCCCORE_1_3; Device: PK616BA; LCSC Part Name: 1个N沟道 耐压:30V 电流:50A; SupplierPart: C133608; ManufacturerPart: PK616BA; Supplier Footprint: PDFN-8(5.8x4.9); JLCPCB Part Class: Extended Part; Datasheet: https://atta.szlcsc.com/upload/public/pdf/source/20170930/C133608_1506736454344997453.pdf; Supplier: LCSC; ConvertToPcb: yes; Type: 1个N沟道; Drain Source On Resistance (RDS(on)@Vgs,Id): 9.5mΩ@4.5V,13A; Gate Threshold Voltage (Vgs(th)@Id): 3V@250uA
  PQ17: FootprintName: PRPAK5X6_4
  PQ18: FootprintName: PRPAK5X6_3
PR56 PR59 PR61 PR231 = 0603WAF220KT5E: as PR28 on sheet CPU_PWR - +VCCCORE_1_3; Device: 0603WAF220KT5E; Value: 2.2Ω; Type: 厚膜电阻; Supplier: LCSC; Datasheet: https://atta.szlcsc.com/upload/public/pdf/source/20200306/C422600_1E6D84923E4A46A82E41ADD87F860B5C.pdf; SupplierPart: C22939; ConvertToPcb: yes; LCSC Part Name: 2.2Ω ±1% 100mW; JLCPCB Part Class: Basic Part; ManufacturerPart: 0603WAF220KT5E; Supplier Footprint: 0603; Operating Temperature Range: -55℃~+155℃
  PR56: FootprintName: R0603_2
  PR59 PR61 PR231: FootprintName: R0603_1
PR57 PR58 = R_1: Check: false; AddInBom: yes; Device: R_1; Symbol: R_0; FootprintName: ISEN_SHORTNI_1; ConvertToPcb: yes
PR60 = 0603WAF0000T5E: as PR34 on sheet CPU_PWR - +VCCCORE_1_3; Device: 0603WAF0000T5E; Value: 0Ω; Type: 厚膜电阻; Supplier: LCSC; Datasheet: https://atta.szlcsc.com/upload/public/pdf/source/20200306/C422600_1E6D84923E4A46A82E41ADD87F860B5C.pdf; FootprintName: R0603_2; SupplierPart: C21189; ConvertToPcb: yes; LCSC Part Name: 0Ω ±1% 100mW; JLCPCB Part Class: Basic Part; ManufacturerPart: 0603WAF0000T5E; Supplier Footprint: 0603; Operating Temperature Range: -55℃~+155℃
PR221 = 0402WGF1002TCE: as PR214 on sheet CPU_PWR - +VCCCORE_1_3; Device: 0402WGF1002TCE; Value: 10kΩ; Type: 厚膜电阻; Supplier: LCSC; Datasheet: https://atta.szlcsc.com/upload/public/pdf/source/20200306/C422600_1E6D84923E4A46A82E41ADD87F860B5C.pdf; FootprintName: R0402_2; SupplierPart: C25744; ConvertToPcb: yes; LCSC Part Name: 10kΩ ±1% 62.5mW; JLCPCB Part Class: Basic Part; ManufacturerPart: 0402WGF1002TCE; Supplier Footprint: 0402; Operating Temperature Range: -55℃~+155℃
PR250 = R-0603_2: as PR240 on sheet CPU_PWR - +VCCCORE_1_3; Device: R-0603_2; Symbol: R-0603; LCSC Part Name: 厚膜电阻 10kΩ ±1% 62.5mW; Supplier Part: C60490; Supplier Footprint: 0402; JLCPCB Part Class: Extended Part; Datasheet: https://atta.szlcsc.com/upload/public/pdf/source/20170925/C131467_1506321478108990263.pdf; Supplier: LCSC; Type: 厚膜电阻; Operating Temperature Range: -55℃~+155℃; FootprintName: R0402_2; ConvertToPcb: yes
PR251 = ERJ2RKF3651X: as PR241 on sheet CPU_PWR - +VCCCORE_1_3; Device: ERJ2RKF3651X; Value: 3.65kΩ; LCSC Part Name: 3.65kΩ ±1% 100mW 厚膜电阻; SupplierPart: C416527; ManufacturerPart: ERJ2RKF3651X; Supplier Footprint: 0402; JLCPCB Part Class: Extended Part; Datasheet: https://atta.szlcsc.com/upload/public/pdf/source/20190902/C416527_C4564A8D72F3E2A9CDC3D7769B95121D.pdf; Supplier: LCSC; ConvertToPcb: yes; FootprintName: R0402; Type: 厚膜电阻; Temperature Coefficient: ±100ppm/℃; Operating Temperature Range: -55℃~+155℃
PU15 = RT9624FGQW: as PU10 on sheet CPU_PWR - +VCCCORE_1_3; Device: RT9624FGQW; LCSC Part Name: Single Phase Synchronous Rectified Buck MOSFET Driver; SupplierPart: C3020454; ManufacturerPart: RT9624FGQW; Supplier Footprint: TDFN-8-EP(3x3); JLCPCB Part Class: Extended Part; Datasheet: https://atta.szlcsc.com/upload/public/pdf/source/20220608/64F557171D909C63F38446B0F2BC2FB2.pdf; Supplier: LCSC; ConvertToPcb: yes; FootprintName: DFN8_3X3MM-GND_1

## Sheet CPU_PWR - 1.8V_1.05V.schdoc
size 420 x 298 mm; Symbol: Sheet-Symbol_A3; Company: 嘉立创EDA; Version: V1.0; Page Size: A3; @Project Name: 【全网首发】X86电脑主板_copy; @Page Count: 26; @Update Date: 2025-10-09; @Create Date: 2025-10-09; @Schematic Name: SCHEMATIC1_1; @Page No: 0; @Page Name: CPU_PWR - 1.8V/1.05V; Device: Sheet-Symbol_A3
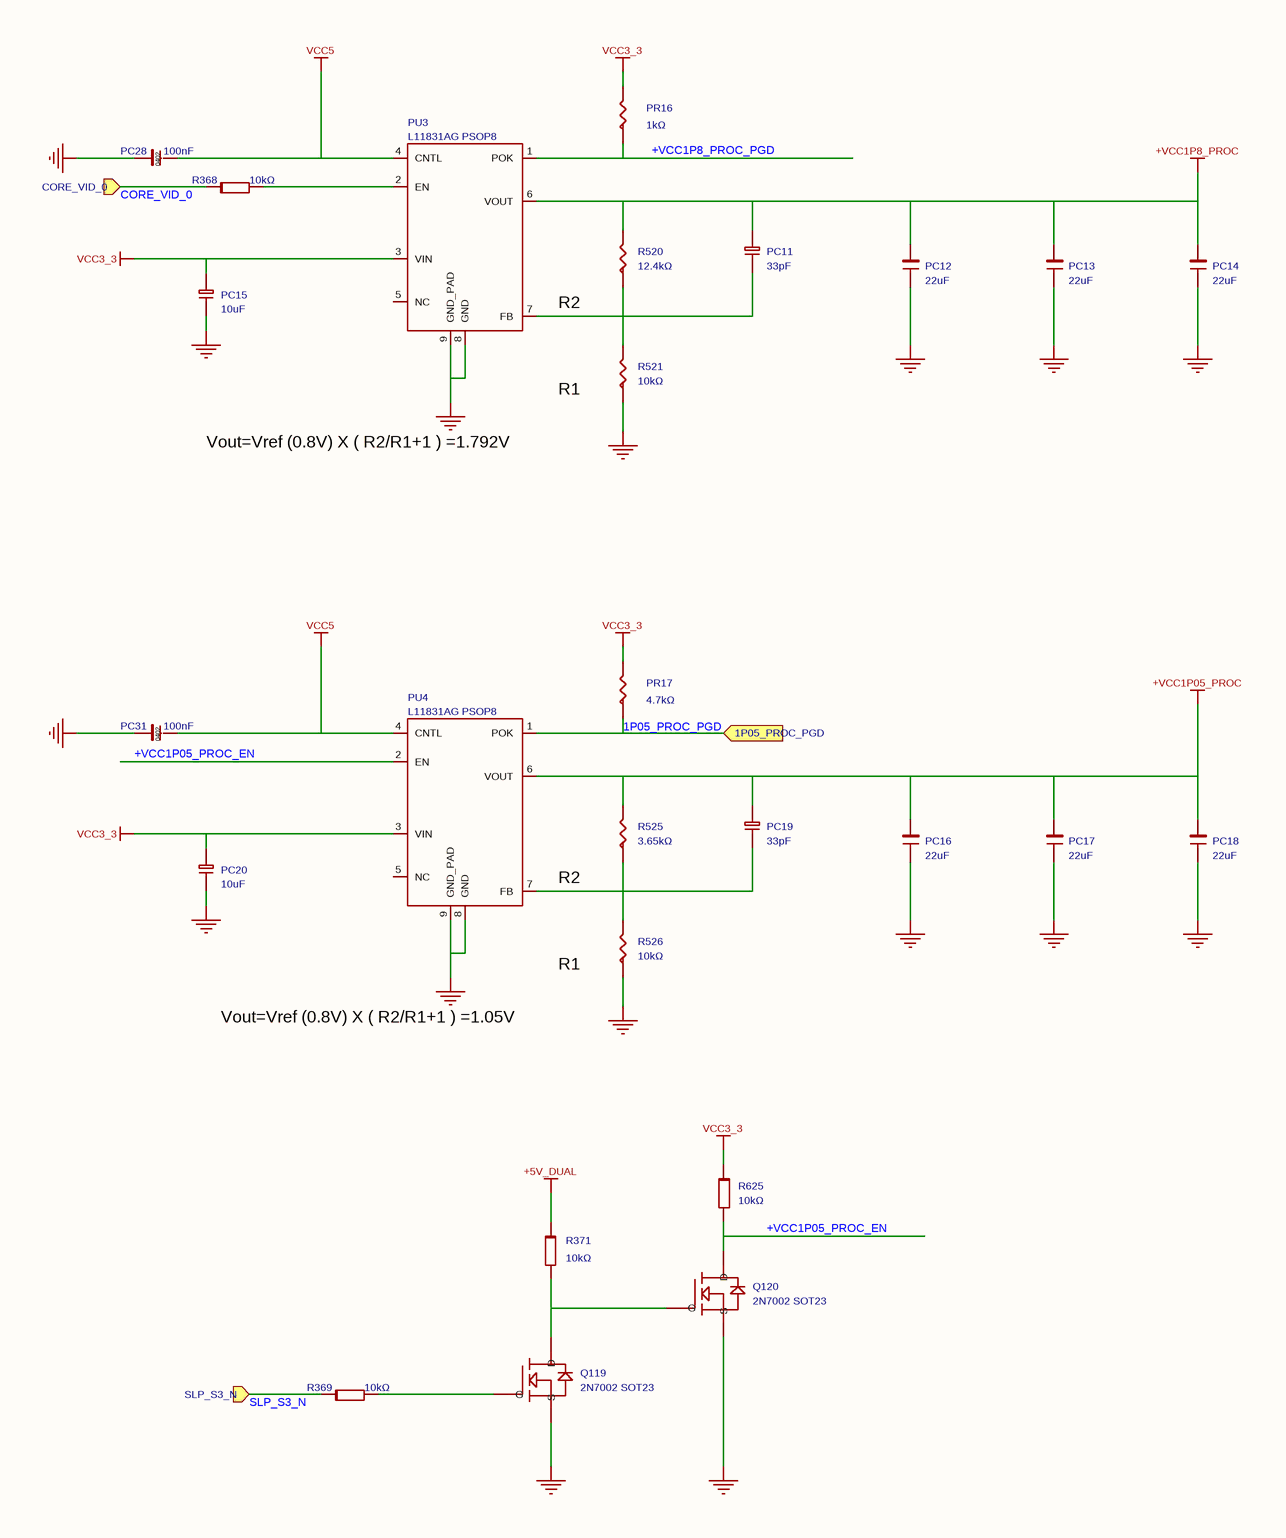
[diagram p16: CPU_PWR - 1.8V_1.05V.schdoc]

### Parts
PC11  33pF  [C0402_3]
PC12  22uF  [C0603_3]
PC13  22uF  [C0603_3]
PC14  22uF  [C0603]
PC15  10uF  [C0603]
PC16  22uF  [C0603]
PC17  22uF  [C0603]
PC18  22uF  [C0603_2]
PC19  33pF  [C0402]
PC20  10uF  [C0603]
PC28  100nF  [C0402_1]
PC31  100nF  [C0402_1]
PR16  1kΩ  [R0402_3]
PR17  4.7kΩ  [R0402_3]
PU3  value L11831AG PSOP8  [SO8_50_150GV_3]  (hidden comment: RT9173B_0)
PU4  value L11831AG PSOP8  [SO8_50_150GV_3]  (hidden comment: RT9173B_0)
Q119  value 2N7002 SOT23  [SOT23_125]  (hidden comment: 2N7002)
Q120  value 2N7002 SOT23  [SOT23_125]  (hidden comment: 2N7002)
R368  10kΩ  [R0402_1]
R369  10kΩ  [R0402_2]
R371  10kΩ  [R0402_2]
R520  12.4kΩ  [R0402_1]
R521  10kΩ  [R0402]
R525  3.65kΩ  [R0402_PP]
R526  10kΩ  [R0402_PP_1]
R625  10kΩ  [R0402_1]

### Ports
1P05_PROC_PGD (in), CORE_VID_0 (in), SLP_S3_N (in)

### Nets
+5V_DUAL: R371.1
+VCC1P05_PROC: PC16.1 PC17.1 PC18.1 PC19.2 PU4.6(VOUT) R525.2
+VCC1P8_PROC: PC11.2 PC12.1 PC13.1 PC14.1 PU3.6(VOUT) R520.2
GND: PC12.2 PC13.2 PC14.2 PC15.2 PC16.2 PC17.2 PC18.2 PC20.2 PC28.1 PC31.1 PU3.8(GND) PU3.9(GND_PAD) PU4.8(GND) PU4.9(GND_PAD) Q119.2(S) Q120.2(S) R521.1 R526.1
VCC3_3: PC15.1 PC20.1 PR16.2 PR17.2 PU3.3(VIN) PU4.3(VIN) R625.1
VCC5: PC28.2 PC31.2 PU3.4(CNTL) PU4.4(CNTL)
1P05_PROC_PGD: PR17.1 PU4.1(POK) ; port 1P05_PROC_PGD
+VCC1P05_PROC_EN: PU4.2(EN) Q120.3(D) R625.2
+VCC1P8_PROC_PGD: PR16.1 PU3.1(POK)
CORE_VID_0: R368.1 ; port CORE_VID_0
SLP_S3_N: R369.1 ; port SLP_S3_N
NetPC11_1: PC11.1 PU3.7(FB) R520.1 R521.2
NetPC19_1: PC19.1 PU4.7(FB) R525.1 R526.2
NetPU3_2: PU3.2(EN) R368.2
NetQ119_1: Q119.1(G) R369.2
NetQ119_3: Q119.3(D) Q120.1(G) R371.2

Not connected (* = marked no-connect by the designer): PU3 5(NC); PU4 5(NC)

### Notes on the sheet
- R2
- Vout=Vref (0.8V) X ( R2/R1+1 ) =1.792V
- R1
- Vout=Vref (0.8V) X ( R2/R1+1 ) =1.05V
- 更新日期
- 2025-10-09
- 原理图
- 图页
- SCHEMATIC1_1
- CPU_PWR - 1.8V/1.05V
- 创建日期
- 物料编码
- 审阅
- 绘制
- 【全网首发】X86电脑主板_copy
- 版本
- V1.0
- 尺寸
- A3
- 页
- 0
- 嘉立创EDA
- 共
- 26

### Library data of the parts
PC11 PC19 = CC0402JRNPO9BN330: 容值:33pF;精度:±5%;额定电压:50V;材质(温度系数):NP0;; Manufacturer: YAGEO(国巨); Symbol: C-0603_3; ModelId: 36a51122f27c49738f86b3bfa98863e0; Tolerance: ±5%; AddInBom: yes; Voltage Rated: 50V; ModelName: C0402_L1.0-W0.5-H0.5; ModelTransform: 39.37,19.685,0,0,0,0,0,0,0; Temperature Coefficient: NP0; Device: CC0402JRNPO9BN330; Value: 33pF; Supplier: LCSC; Datasheet: https://atta.szlcsc.com/upload/public/pdf/source/20171026/C107005_15089856307561059550.pdf; SupplierPart: C107005; ConvertToPcb: yes; LCSC Part Name: 33pF ±5% 50V; JLCPCB Part Class: Extended Part; ManufacturerPart: CC0402JRNPO9BN330; Supplier Footprint: 0402
  PC11: FootprintName: C0402_3
  PC19: FootprintName: C0402
PC12-PC14 PC16-PC18 = CL10A226MQ8NRNC: 容值:22uF;精度:±20%;额定电压:6.3V;材质(温度系数):X5R;; Manufacturer: SAMSUNG(三星); Symbol: C0805; AddInBom: yes; Tolerance: ±20%; Voltage Rated: 6.3V; Temperature Coefficient: X5R; ModelId: ac125912035d415993ca9572d50418b1; ModelName: C0603_L1.6-W0.8-H0.8; ModelTransform: 62.992,31.496,0,0,0,0,0,0,0; Device: CL10A226MQ8NRNC; Value: 22uF; LCSC Part Name: 22uF ±20% 6.3V; SupplierPart: C59461; ManufacturerPart: CL10A226MQ8NRNC; Supplier Footprint: 0603; JLCPCB Part Class: Basic Part; Datasheet: https://atta.szlcsc.com/upload/public/pdf/source/20160218/1457707763339.pdf; Supplier: LCSC; ConvertToPcb: yes
  PC12 PC13: FootprintName: C0603_3
  PC14 PC16 PC17: FootprintName: C0603
  PC18: FootprintName: C0603_2
PC15 PC20 = CL10A106MQ8NNNC: 容值:10uF;精度:±20%;额定电压:6.3V;材质(温度系数):X5R;; Manufacturer: SAMSUNG(三星); Symbol: CAP; Tolerance: ±20%; ModelId: ac125912035d415993ca9572d50418b1; AddInBom: yes; Voltage Rated: 6.3V; ModelName: C0603_L1.6-W0.8-H0.8; ModelTransform: 62.992,31.496,0,0,0,0,0,0,0; Temperature Coefficient: X5R; Device: CL10A106MQ8NNNC; PCB Footprint: C0603; Value: 10uF; Supplier: LCSC; Datasheet: https://atta.szlcsc.com/upload/public/pdf/source/20160103/1457707690948.pdf; FootprintName: C0603; SupplierPart: C1691; ConvertToPcb: yes; LCSC Part Name: 10uF ±20% 6.3V; JLCPCB Part Class: Extended Part; ManufacturerPart: CL10A106MQ8NNNC; Supplier Footprint: 0603
PC28 PC31 = CL05B104KO5NNNC: as AC20 on sheet AUDIO - ALC897_3CH; Device: CL05B104KO5NNNC; Value: 100nF; Supplier: LCSC; Datasheet: https://atta.szlcsc.com/upload/public/pdf/source/20160103/1457707674891.pdf; FootprintName: C0402_1; SupplierPart: C1525; ConvertToPcb: yes; LCSC Part Name: 100nF ±10% 16V; JLCPCB Part Class: Basic Part; ManufacturerPart: CL05B104KO5NNNC; Supplier Footprint: 0402
PR16 = 0402WGF1001TCE: 电阻类型:厚膜电阻;阻值:1kΩ;精度:±1%;功率:62.5mW;; Manufacturer: UNI-ROYAL(厚声); Symbol: R-0603_0; ModelId: 671aefced39d4c318694bba8bd8efd39; Tolerance: ±1%; AddInBom: yes; Power(Watts): 62.5mW; ModelName: R0402_L1.0-W0.5-H0.5; ModelTransform: 39.37,19.685,0,0,0,0,0,0.0005,0; Overload Voltage (Max): 50V; Temperature Coefficient: ±100ppm/℃; Device: 0402WGF1001TCE; Value: 1kΩ; Type: 厚膜电阻; Supplier: LCSC; Datasheet: https://atta.szlcsc.com/upload/public/pdf/source/20200306/C422600_1E6D84923E4A46A82E41ADD87F860B5C.pdf; FootprintName: R0402_3; SupplierPart: C11702; ConvertToPcb: yes; LCSC Part Name: 1kΩ ±1% 62.5mW; JLCPCB Part Class: Basic Part; ManufacturerPart: 0402WGF1001TCE; Supplier Footprint: 0402; Operating Temperature Range: -55℃~+155℃
PR17 = 0402WGF4701TCE: 电阻类型:厚膜电阻;阻值:4.7kΩ;精度:±1%;功率:62.5mW;; Manufacturer: UNI-ROYAL(厚声); Symbol: R-0603_0; ModelId: 671aefced39d4c318694bba8bd8efd39; Tolerance: ±1%; AddInBom: yes; Power(Watts): 62.5mW; ModelName: R0402_L1.0-W0.5-H0.5; ModelTransform: 39.37,19.685,0,0,0,0,0,0.0005,0; Overload Voltage (Max): 50V; Temperature Coefficient: ±100ppm/℃; Device: 0402WGF4701TCE; Value: 4.7kΩ; Type: 厚膜电阻; Supplier: LCSC; Datasheet: https://atta.szlcsc.com/upload/public/pdf/source/20200306/C422600_1E6D84923E4A46A82E41ADD87F860B5C.pdf; FootprintName: R0402_3; SupplierPart: C25900; ConvertToPcb: yes; LCSC Part Name: 4.7kΩ ±1% 62.5mW; JLCPCB Part Class: Basic Part; ManufacturerPart: 0402WGF4701TCE; Supplier Footprint: 0402; Operating Temperature Range: -55℃~+155℃
PU3 PU4 = RT9173B_0: Check: false; AddInBom: yes; Device: RT9173B_0; Symbol: RT9173B_0; FootprintName: SO8_50_150GV_3; ConvertToPcb: yes
Q119 Q120 = 2N7002_C8545: 类型:N沟道;漏源电压(Vdss):60V;连续漏极电流(Id):115mA;功率(Pd):200mW;导通电阻(RDS(on)@Vgs,Id):7.5Ω@10V,500mA;阈值电压(Vgs(th)@Id):2.5V@250uA;; Manufacturer: CJ(江苏长电/长晶); Symbol: MOS,2N7002,SOT23,60V,300mA_0; Type: N沟道; ModelId: c62791f0466c4ae2a892c056b845b0ca; AddInBom: yes; ModelName: SOT-23-3P_L2.9-W1.3-H1.0-LS2.4-P0.95; ModelTransform: 98.425,114.173,0,180,0,0,0.0005,-0.0005,0; Power Dissipation (Pd): 200mW; Drain Source Voltage (Vdss): 60V; Continuous Drain Current (Id): 115mA; Device: 2N7002_C8545; Supplier: LCSC; Datasheet: https://atta.szlcsc.com/upload/public/pdf/source/20170302/1488422688078.pdf; FootprintName: SOT23_125; SupplierPart: C8545; ConvertToPcb: yes; LCSC Part Name: N沟道 60V 115mA; JLCPCB Part Class: Basic Part; ManufacturerPart: 2N7002; Supplier Footprint: SOT-23; Gate Threshold Voltage (Vgs(th)@Id): 2.5V@250uA; Drain Source On Resistance (RDS(on)@Vgs,Id): 7.5Ω@10V,500mA
R368 R369 R371 R625 = 0402WGF1002TCE: 电阻类型:厚膜电阻;阻值:10kΩ;精度:±1%;功率:62.5mW;; Manufacturer: UNI-ROYAL(厚声); Symbol: R0402; ModelId: 671aefced39d4c318694bba8bd8efd39; Tolerance: ±1%; AddInBom: yes; Power(Watts): 62.5mW; ModelName: R0402_L1.0-W0.5-H0.5; ModelTransform: 39.37,19.685,0,0,0,0,0,0.0005,0; Overload Voltage (Max): 50V; Temperature Coefficient: ±100ppm/℃; Device: 0402WGF1002TCE; Value: 10kΩ; Type: 厚膜电阻; Supplier: LCSC; Datasheet: https://atta.szlcsc.com/upload/public/pdf/source/20200306/C422600_1E6D84923E4A46A82E41ADD87F860B5C.pdf; SupplierPart: C25744; ConvertToPcb: yes; LCSC Part Name: 10kΩ ±1% 62.5mW; JLCPCB Part Class: Basic Part; ManufacturerPart: 0402WGF1002TCE; Supplier Footprint: 0402; Operating Temperature Range: -55℃~+155℃
  R368 R625: FootprintName: R0402_1
  R369 R371: FootprintName: R0402_2
R520 = 0402WGF1242TCE: 电阻类型:厚膜电阻;阻值:12.4kΩ;精度:±1%;功率:62.5mW;; Manufacturer: UNI-ROYAL(厚声); Symbol: 42A**-F; PCB Footprint: R0402; ModelId: 671aefced39d4c318694bba8bd8efd39; Tolerance: ±1%; AddInBom: yes; Power(Watts): 62.5mW; ModelName: R0402_L1.0-W0.5-H0.5; ModelTransform: 39.37,19.685,0,0,0,0,0,0.0005,0; Overload Voltage (Max): 50V; Temperature Coefficient: ±100ppm/℃; Device: 0402WGF1242TCE; Value: 12.4kΩ; Type: 厚膜电阻; Supplier: LCSC; Datasheet: https://atta.szlcsc.com/upload/public/pdf/source/20200306/C422600_1E6D84923E4A46A82E41ADD87F860B5C.pdf; FootprintName: R0402_1; SupplierPart: C11692; ConvertToPcb: yes; LCSC Part Name: 12.4kΩ ±1% 62.5mW; JLCPCB Part Class: Extended Part; ManufacturerPart: 0402WGF1242TCE; Supplier Footprint: 0402; Operating Temperature Range: -55℃~+155℃
R521 = 0402WGF1002TCE: 电阻类型:厚膜电阻;阻值:10kΩ;精度:±1%;功率:62.5mW;; Manufacturer: UNI-ROYAL(厚声); Symbol: 42A**-F; ModelId: 671aefced39d4c318694bba8bd8efd39; Tolerance: ±1%; AddInBom: yes; Power(Watts): 62.5mW; ModelName: R0402_L1.0-W0.5-H0.5; ModelTransform: 39.37,19.685,0,0,0,0,0,0.0005,0; Overload Voltage (Max): 50V; Temperature Coefficient: ±100ppm/℃; Device: 0402WGF1002TCE; PCB Footprint: R0402; Value: 10kΩ; Type: 厚膜电阻; Supplier: LCSC; Datasheet: https://atta.szlcsc.com/upload/public/pdf/source/20200306/C422600_1E6D84923E4A46A82E41ADD87F860B5C.pdf; FootprintName: R0402; SupplierPart: C25744; ConvertToPcb: yes; LCSC Part Name: 10kΩ ±1% 62.5mW; JLCPCB Part Class: Basic Part; ManufacturerPart: 0402WGF1002TCE; Supplier Footprint: 0402; Operating Temperature Range: -55℃~+155℃
R525 = ERJ2RKF3651X: 电阻类型:厚膜电阻;阻值:3.65kΩ;精度:±1%;功率:100mW;最大工作电压:100V;温度系数:±100ppm/℃;; Manufacturer: PANASONIC(松下); Symbol: 42A**-F; AddInBom: yes; ModelId: 671aefced39d4c318694bba8bd8efd39; ModelName: R0402_L1.0-W0.5-H0.5; ModelTransform: 39.37,19.685,0,0,0,0,0,0.0005,0; Tolerance: ±1%; Power(Watts): 100mW; Overload Voltage (Max): 100V; Device: ERJ2RKF3651X; PCB Footprint: R0402_PP; Value: 3.65kΩ; LCSC Part Name: 3.65kΩ ±1% 100mW 厚膜电阻; SupplierPart: C416527; ManufacturerPart: ERJ2RKF3651X; Supplier Footprint: 0402; JLCPCB Part Class: Extended Part; Datasheet: https://atta.szlcsc.com/upload/public/pdf/source/20190902/C416527_C4564A8D72F3E2A9CDC3D7769B95121D.pdf; Supplier: LCSC; ConvertToPcb: yes; FootprintName: R0402_PP; Type: 厚膜电阻; Temperature Coefficient: ±100ppm/℃; Operating Temperature Range: -55℃~+155℃
R526 = 0402WGF1002TCE: 电阻类型:厚膜电阻;阻值:10kΩ;精度:±1%;功率:62.5mW;; Manufacturer: UNI-ROYAL(厚声); Symbol: 42A**-F; PCB Footprint: R0402_PP; ModelId: 671aefced39d4c318694bba8bd8efd39; Tolerance: ±1%; AddInBom: yes; Power(Watts): 62.5mW; ModelName: R0402_L1.0-W0.5-H0.5; ModelTransform: 39.37,19.685,0,0,0,0,0,0.0005,0; Overload Voltage (Max): 50V; Temperature Coefficient: ±100ppm/℃; Device: 0402WGF1002TCE; Value: 10kΩ; Type: 厚膜电阻; Supplier: LCSC; Datasheet: https://atta.szlcsc.com/upload/public/pdf/source/20200306/C422600_1E6D84923E4A46A82E41ADD87F860B5C.pdf; FootprintName: R0402_PP_1; SupplierPart: C25744; ConvertToPcb: yes; LCSC Part Name: 10kΩ ±1% 62.5mW; JLCPCB Part Class: Basic Part; ManufacturerPart: 0402WGF1002TCE; Supplier Footprint: 0402; Operating Temperature Range: -55℃~+155℃